# Altium schematic sheet Relay-10-Sheet.SchDoc
size 420 x 297 mm; SheetNumber: 5; SheetTotal: 5
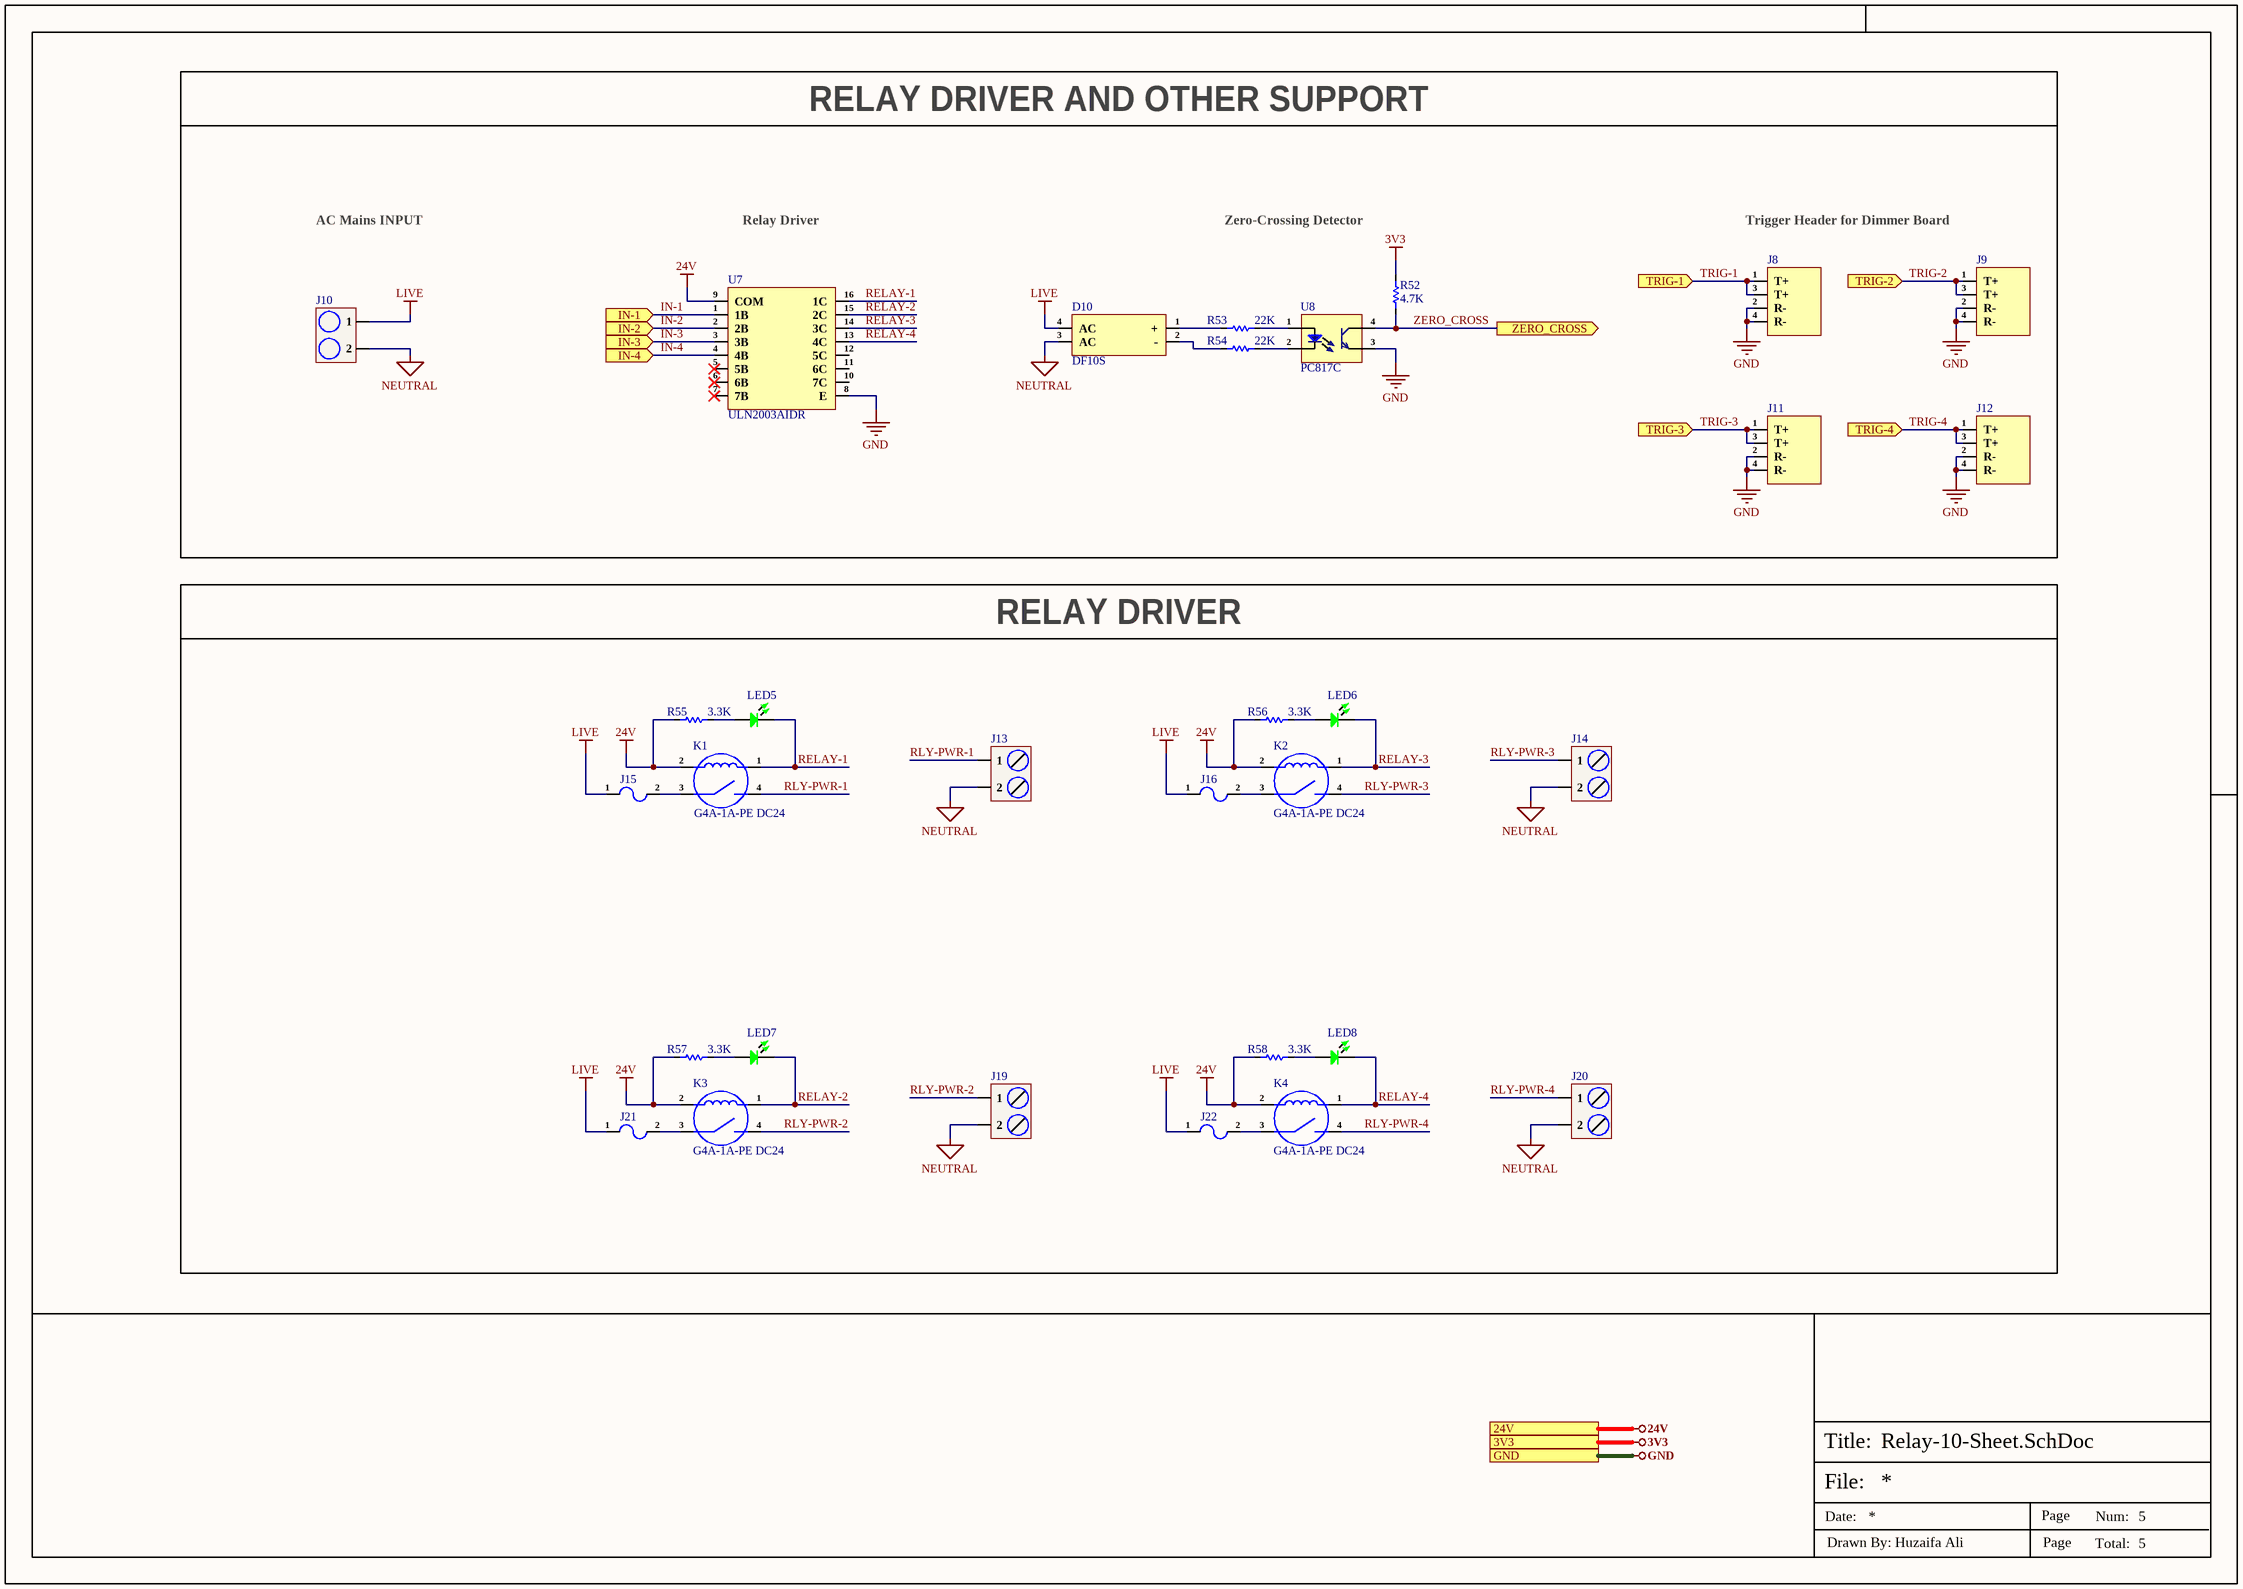
[diagram p0: Relay-10-Sheet.SchDoc]

## Parts
D10  DF10S  [DF10S]
J8  R-RJ11R04P-A802  [R-RJ11R04P-A802]  (value not drawn)
J9  R-RJ11R04P-A802  [R-RJ11R04P-A802]  (value not drawn)
J10  KF88SA-16.0-2P  [KF88SA-16.0-2P]  (value not drawn)
J11  R-RJ11R04P-A802  [R-RJ11R04P-A802]  (value not drawn)
J12  R-RJ11R04P-A802  [R-RJ11R04P-A802]  (value not drawn)
J13  DBT50G-7.62-2P-BK-P  [DBT50G-7.62-2P-BK-P]  (value not drawn)
J14  DBT50G-7.62-2P-BK-P  [DBT50G-7.62-2P-BK-P]  (value not drawn)
J15  03540101ZXGY  [03540101ZXGY]  (value not drawn)
J16  03540101ZXGY  [03540101ZXGY]  (value not drawn)
J19  DBT50G-7.62-2P-BK-P  [DBT50G-7.62-2P-BK-P]  (value not drawn)
J20  DBT50G-7.62-2P-BK-P  [DBT50G-7.62-2P-BK-P]  (value not drawn)
J21  03540101ZXGY  [03540101ZXGY]  (value not drawn)
J22  03540101ZXGY  [03540101ZXGY]  (value not drawn)
K1  G4A-1A-PE DC24  [G4A-1A-PE DC24]
K2  G4A-1A-PE DC24  [G4A-1A-PE DC24]
K3  G4A-1A-PE DC24  [G4A-1A-PE DC24]
K4  G4A-1A-PE DC24  [G4A-1A-PE DC24]
LED5  NFD5408UGD  [TH LED 5mm Green]  (value not drawn)
LED6  NFD5408UGD  [TH LED 5mm Green]  (value not drawn)
LED7  NFD5408UGD  [TH LED 5mm Green]  (value not drawn)
LED8  NFD5408UGD  [TH LED 5mm Green]  (value not drawn)
R52  4.7K  [Res-0402]
R53  22K  [RES-2512]
R54  22K  [RES-2512]
R55  3.3K  [Res-0402]
R56  3.3K  [Res-0402]
R57  3.3K  [Res-0402]
R58  3.3K  [Res-0402]
U7  ULN2003AIDR  [16-SOIC (0.154", 3.90mm Width)]
U8  PC817C  [PC817C]

## Blocks framed on the sheet
RELAY DRIVER AND OTHER SUPPORT: D10 J8-J12 R52-R54 U7 U8
RELAY DRIVER: J13-J16 J19-J22 K1-K4 LED5-LED8 R55-R58

## Ports
3V3 (see Top-Sheet[5B], Comms-Sheet[4D], Controller-Sheet[4D], Power-Sheet[4D]), 24V (see Top-Sheet[5B], Power-Sheet[4D]), GND (see Top-Sheet[5B], Comms-Sheet[4D], Controller-Sheet[4D], Power-Sheet[4D]), IN-1 (in, see Top-Sheet[5B]), IN-2 (in, see Top-Sheet[5B]), IN-3 (in, see Top-Sheet[5B]), IN-4 (in, see Top-Sheet[5B]), TRIG-1 (in, see Top-Sheet[5B]), TRIG-2 (in, see Top-Sheet[5B]), TRIG-3 (in, see Top-Sheet[5B]), TRIG-4 (in, see Top-Sheet[5B]), ZERO_CROSS (out, see Top-Sheet[5B])

## Nets
3V3: R52.2 ; port 3V3
24V: K1.2 K2.2 K3.2 K4.2 R55.1 R56.1 R57.1 R58.1 U7.9(COM) ; port 24V
GND: J8.2(R-) J8.4(R-) J9.2(R-) J9.4(R-) J11.2(R-) J11.4(R-) J12.2(R-) J12.4(R-) U7.8(E) U8.3(E) ; port GND
LIVE: D10.4(AC) J10.1 J15.1 J16.1 J21.1 J22.1
NEUTRAL: D10.3(AC) J10.2 J13.2 J14.2 J19.2 J20.2
IN-1: U7.1(1B) ; port IN-1
IN-2: U7.2(2B) ; port IN-2
IN-3: U7.3(3B) ; port IN-3
IN-4: U7.4(4B) ; port IN-4
RELAY-1: K1.1 LED5.1 U7.16(1C)
RELAY-2: K3.1 LED7.1 U7.15(2C)
RELAY-3: K2.1 LED6.1 U7.14(3C)
RELAY-4: K4.1 LED8.1 U7.13(4C)
RLY-PWR-1: J13.1 K1.4
RLY-PWR-2: J19.1 K3.4
RLY-PWR-3: J14.1 K2.4
RLY-PWR-4: J20.1 K4.4
TRIG-1: J8.1(T+) J8.3(T+) ; port TRIG-1
TRIG-2: J9.1(T+) J9.3(T+) ; port TRIG-2
TRIG-3: J11.1(T+) J11.3(T+) ; port TRIG-3
TRIG-4: J12.1(T+) J12.3(T+) ; port TRIG-4
ZERO_CROSS: R52.1 U8.4(C) ; port ZERO_CROSS
NetD10_1: D10.1(+) R53.1
NetD10_2: D10.2(-) R54.1
NetJ15_2: J15.2 K1.3
NetJ16_2: J16.2 K2.3
NetJ21_2: J21.2 K3.3
NetJ22_2: J22.2 K4.3
NetLED5_2: LED5.2 R55.2
NetLED6_2: LED6.2 R56.2
NetLED7_2: LED7.2 R57.2
NetLED8_2: LED8.2 R58.2
NetR53_2: R53.2 U8.1(An)
NetR54_2: R54.2 U8.2(Ca)

Not connected (* = marked no-connect by the designer): U7 5(5B)* 6(6B)* 7(7B)* 10(7C) 11(6C) 12(5C)

## Notes on the sheet
- AC Mains INPUT
- Relay Driver
- Zero-Crossing Detector
- Trigger Header for Dimmer Board
- File:
- Title:
- Date:
- Page
- Num:
- Total:
- Drawn By: Huzaifa Ali

## Library data of the parts
D10 = DF10S: 50A 1.1V@1A 1A 1kV DBS Bridge Rectifiers ROHS; Manufacturer: MSKSEMI; Manufacturer Part Number: DF10S; Package: DBS; LCSC Part Number: C5174636; Item Type: Bridge Rectifier; ComponentLink1Description: LCSC; ComponentLink1URL: https://www.lcsc.com/product-detail/Bridge-Rectifiers_MSKSEMI-DF10S_C5174636.html
J8 J9 J11 J12 = R-RJ11R04P-A802: RJ11Receptacle 1 Plugin Ethernet Connectors / Modular Connectors (RJ45 RJ11) ROHS; Manufacturer: Ckmtw(Shenzhen Cankemeng); Manufacturer Part Number: R-RJ11R04P-A802; Package: Plugin; LCSC Part Number: C189737; Item Type: (RJ45 RJ11); ComponentLink1Description: LCSC; ComponentLink1URL: https://www.lcsc.com/product-detail/Ethernet-Connectors-Modular-Connectors-RJ45-RJ11_Ckmtw-Shenzhen-Cankemeng-R-RJ11R04P-A802_C189737.html
J10 = KF88SA-16.0-2P: 1x2P Barrier Block 2 1 16mm -40℃~+105℃ 76A 1kV Black 6~14 Straight pin 16 Plugin,P=16mm Barrier Terminal Blocks ROHS; Manufacturer: CiXi KaiFeng Electronics; Supplier: LCSC; LCSC Part Number: C707749; Manufacturer Part Number: KF88SA-16.0-2P; RoHS: No; Item Type: Terminal Block; ComponentLink1Description: LCSC; ComponentLink1URL: https://www.lcsc.com/product-detail/Barrier-Terminal-Blocks_Cixi-Kefa-Elec-KF88SA-16-0-2P_C707749.html
J13 J14 J19 J20 = DBT50G-7.62-2P-BK-P: 1x2P Corner With Cover Plate 2 1 7.62mm -40℃~+105℃ 20A 300V Black 12~22 Straight Needle Plugin,P=7.62mm Barrier Terminal Blocks ROHS; Manufacturer: DORABO; Manufacturer Part Number: DBT50G-7.62-2P-BK-P; Package: Plugin,P=7.62mm; LCSC Part Number: C496127; Item Type: Terminal Block; ComponentLink1Description: LCSC; ComponentLink1URL: https://www.lcsc.com/product-detail/Barrier-Terminal-Blocks_DORABO-DBT50G-7-62-2P-BK-P_C496127.html
J15 J16 J21 J22 = 03540101ZXGY: FUSE BLOCK CART 600V 15A PCB; Manufacturer: Littelfuse; Body Material: Bronze,Tin; Voltage Rating: 300V; Number of Poles: 1; Fuse Size: 0.25 Dia x 1.26 L (6.35mm x 32mm); Supplier: Rs; Supplier Part Number: 1740648; Manufacturer Part Number: 03540101ZXGY; RoHS: Yes; Category: Fuse Holders; Stock: 169; Mounting Technology: Through Hole; Case/Package: 300; Contact Material: Bronze; Contact Plating: Tin; Material: Thermoplastic; Color: Grey; Min Operating Temperature: -40°C; Max Operating Temperature: 85°C; Current Rating: 15A; Package Quantity: 50; Packaging: Bulk; Voltage Rating (DC): 300V; Voltage Rating (AC): 300V; Number of Circuits: 1; Voltage: 600V; Termination: PC Pin; Fuse Current: 15A; Orientation: Horizontal; Series: OMNI-BLOK® 354; Length: 12.7mm; Width: 12.7mm; Depth: 35.56mm; Reach SVHC Compliant: No; Lead Free: Lead Free; Flammability Rating: UL94 V-0; ComponentLink1URL: https://datasheet.ciiva.com/15187/getdatasheetpartid-114928-15187899.pdf?src-supplier=Verical; ComponentLink1Description: https://datasheet.ciiva.com/15187/getdatasheetpartid-114928-15187899.pdf?src-supplier=Verical; ComponentLink2URL: https://datasheet.ciiva.com/16208/354-omniblok-16208437.pdf?src-supplier=Future+Electronics; ComponentLink2Description: https://datasheet.ciiva.com/16208/354-omniblok-16208437.pdf?src-supplier=Future+Electronics; ComponentLink3URL: https://datasheet.ciiva.com/1269/354-omniblok-1269606.pdf?src-supplier=Element14; ComponentLink3Description: https://datasheet.ciiva.com/1269/354-omniblok-1269606.pdf?src-supplier=Element14
K1-K4 = G4A-1A-PE DC24: RELAY GEN PURPOSE SPST 20A 24V; Manufacturer: Omron; Supplier: Arrow Electronics; LCSC Part Number: C231366; Manufacturer Part Number: G4A-1A-PE DC24; RoHS: Yes; Item Type: Relay; Stock: 435; Pricing: 20=4.964, 50=4.555, 100=4.412 (USD); ComponentLink1URL: https://omronfs.omron.com/en_US/ecb/products/pdf/en-g4a.pdf?src-supplier=Digikey; ComponentLink1Description: https://omronfs.omron.com/en_US/ecb/products/pdf/en-g4a.pdf?src-supplier=Digikey; ComponentLink2URL: https://datasheet.octopart.com/G4A-1A-PE-DC24-Omron-datasheet-8474777.pdf?src-supplier=Newark; ComponentLink2Description: https://datasheet.octopart.com/G4A-1A-PE-DC24-Omron-datasheet-8474777.pdf?src-supplier=Newark; ComponentLink3URL: https://datasheet.octopart.com/G4A-1A-PE-DC24-Omron-datasheet-151868987.pdf?src-supplier=Master+Electronics; ComponentLink3Description: https://datasheet.octopart.com/G4A-1A-PE-DC24-Omron-datasheet-151868987.pdf?src-supplier=Master+Electronics
LED5-LED8 = NFD5408UGD: 515nm~525nm -30℃~+85℃ Emerald 30° 200mW Plugin,D=5mm LED Indication - Discrete ROHS; Manufacturer: Foshan; Manufacturer Part Number: NFD5408UGD; Package: Plugin,D=5mm; LCSC Part Number: C20618157; Item Type: LED; ComponentLink1Description: LCSC; ComponentLink1URL: https://www.lcsc.com/product-detail/LED-Indication-Discrete_Foshan-NationStar-Optoelectronics-NFD5408UGD_C20618157.html
R52 = RC0402FR-074K7L: RES 4.7K OHM 1% 1/16W 0402; Manufacturer: Yageo; Voltage Rating (DC): 50V; Power Rating: 62.5mW; Resistance: 4.7kR; Temperature Coefficient: 100ppm/°C; Max Power Dissipation: 63mW; Item Type: Resistor; Supplier 1: Avnet; Manufacturer Part Number: RC0402FR-074K7L; RoHS: Yes; Category: Chip SMD Resistors; Stock 1: 2420000; Pricing 1: 10000=0.00085 (USD); Case/Package: 0402; Number of Pins: 2; Case Code (Imperial): 0402; Case Code (Metric): 1005; Size Code: 0402; Min Operating Temperature: -55°C; Max Operating Temperature: 155°C; Tolerance: 1%; Voltage Rating: 50V; Packaging: Tape and Reel; Resistor Type: Thick Film; Termination: SMD/SMT; Features: Moisture Resistant; Series: RC; Number of Terminations: 2; Resistance Tolerance: 1%; Construction: Rectangular; Length: 1mm; Width: 0.5mm; Height: 0.32mm; Depth: 0.5mm; Height - Seated (Max): 0.016inch; RoHS Compliant: Yes; Reach SVHC Compliant: Yes; Military Standard: Not; Lead Free: Lead Free; ComponentLink1URL: https://datasheet.ciiva.com/22661/1686128-22661342.pdf?src-supplier=Element14; ComponentLink1Description: https://datasheet.ciiva.com/22661/1686128-22661342.pdf?src-supplier=Element14; ComponentLink2URL: https://datasheet.ciiva.com/7850/1018594-7850022.pdf?src-supplier=Element14; ComponentLink2Description: https://datasheet.ciiva.com/7850/1018594-7850022.pdf?src-supplier=Element14; ComponentLink3URL: https://datasheet.ciiva.com/7850/1018594-7850023.pdf?src-supplier=Element14; ComponentLink3Description: https://datasheet.ciiva.com/7850/1018594-7850023.pdf?src-supplier=Element14; ComponentLink4URL: https://datasheet.ciiva.com/15215/getdatasheetpartid-328119-15215035.pdf?src-supplier=Verical; ComponentLink4Description: https://datasheet.ciiva.com/15215/getdatasheetpartid-328119-15215035.pdf?src-supplier=Verical; Supplier Part Number 1: RC0402FR-074K7L; LCSC Part Number: C105871
R53 R54 = WR25X223JTL: 1W 250V ±100ppm/℃ ±5% 22kΩ 2512 Chip Resistor - Surface Mount ROHS; Manufacturer: Walsin Tech Corp; Manufacturer Part Number: WR25X223JTL; Package: 2512; LCSC Part Number: C396242; Item Type: Resistor; ComponentLink1Description: LCSC; ComponentLink1URL: https://www.lcsc.com/product-detail/Chip-Resistor-Surface-Mount_Walsin-Tech-Corp-WR25X223JTL_C396242.html
R55-R58 = RC0402FR-073K3L: RES 3.3K OHM 1% 1/16W 0402; Manufacturer: Yageo; Resistance: 3.3kR; Power Rating: 62.5mW; Voltage Rating: 50V; Temperature Coefficient: 100ppm/°C; Max Power Dissipation: 63mW; Item Type: Resistor; Supplier 1: Mouser; Manufacturer Part Number: RC0402FR-073K3L; RoHS: Yes; Category: Chip SMD Resistors; Stock 1: 2413047; Pricing 1: 1=0.10000, 10=0.01400, 50=0.01400, 100=0.00600, 1000=0.00300, 5000=0.00200, 10000=0.00100 (USD); Case/Package: 0402; Number of Pins: 2; Case Code (Imperial): 0402; Case Code (Metric): 1005; Size Code: 0402; Min Operating Temperature: -55°C; Max Operating Temperature: 155°C; Tolerance: 1%; Voltage Rating (DC): 50V; Packaging: Tape and Reel; Package Quantity: 1; Termination: SMD/SMT; Resistor Type: Thick Film; Number of Terminations: 2; Features: Moisture Resistant; Series: RC; Resistance Tolerance: 1%; Technology: THICK FILM; Construction: Rectangular; Length: 1mm; Width: 0.5mm; Height: 0.016inch; Depth: 0.5mm; RoHS Compliant: Yes; REACH SVHC: No SVHC; Military Standard: Not; Lead Free: Lead Free; ComponentLink1URL: https://datasheet.ciiva.com/11808/0900766b80c66297-11808441.pdf?src-supplier=RSComponents; ComponentLink1Description: https://datasheet.ciiva.com/11808/0900766b80c66297-11808441.pdf?src-supplier=RSComponents; ComponentLink2URL: https://datasheet.ciiva.com/46394/1018594-46394940.pdf?src-supplier=Element14; ComponentLink2Description: https://datasheet.ciiva.com/46394/1018594-46394940.pdf?src-supplier=Element14; ComponentLink3URL: https://datasheet.ciiva.com/2453/pyu-r-int-thick-7-2453395.pdf?src-supplier=Digi-Key; ComponentLink3Description: https://datasheet.ciiva.com/2453/pyu-r-int-thick-7-2453395.pdf?src-supplier=Digi-Key; ComponentLink4URL: https://datasheet.ciiva.com/2453/pyu-r-int-thick-7-2453396.pdf?src-supplier=Digi-Key; ComponentLink4Description: https://datasheet.ciiva.com/2453/pyu-r-int-thick-7-2453396.pdf?src-supplier=Digi-Key; ComponentLink5URL: https://datasheet.ciiva.com/2453/pyu-r-int-thick-7-2453394.pdf?src-supplier=Digi-Key; ComponentLink5Description: https://datasheet.ciiva.com/2453/pyu-r-int-thick-7-2453394.pdf?src-supplier=Digi-Key; ComponentLink6URL: https://datasheet.ciiva.com/16746/pyu-rc0402-51-rohs-l-6-r-16746361.pdf?src-supplier=Future+Electronics; ComponentLink6Description: https://datasheet.ciiva.com/16746/pyu-rc0402-51-rohs-l-6-r-16746361.pdf?src-supplier=Future+Electronics; Supplier Part Number 1: 603-RC0402FR-073K3L; LCSC Part Number: C137992
U7 = ULN2003AIDR: IC PWR RELAY 7NPN 1:1 16SOIC; Manufacturer: Texas Instruments; Supplier: Mouser; Supplier Part Number: 595-ULN2003AIDR; Manufacturer Part Number: ULN2003AIDR; RoHS: Yes; Item Type: IC; Stock: 2012; Pricing: 1=0.66, 10=0.589, 50=0.589, 100=0.402, 1000=0.285, 10000=0.232 (USD); ComponentLink1URL: https://datasheet.ciiva.com/15139/getdatasheetpartid-47948-15139878.pdf?src-supplier=Verical; ComponentLink1Description: https://datasheet.ciiva.com/15139/getdatasheetpartid-47948-15139878.pdf?src-supplier=Verical; ComponentLink2URL: https://datasheet.ciiva.com/14424/ulq2003a-14424030.pdf?src-supplier=Avnet; ComponentLink2Description: https://datasheet.ciiva.com/14424/ulq2003a-14424030.pdf?src-supplier=Avnet; ComponentLink3URL: https://datasheet.ciiva.com/1700/uln2003ai-1700820.pdf?src-supplier=Digikey; ComponentLink3Description: https://datasheet.ciiva.com/1700/uln2003ai-1700820.pdf?src-supplier=Digikey; ComponentLink4URL: https://datasheet.ciiva.com/1700/uln2003ai-1700821.pdf?src-supplier=Digikey; ComponentLink4Description: https://datasheet.ciiva.com/1700/uln2003ai-1700821.pdf?src-supplier=Digikey; ComponentLink5URL: https://datasheet.ciiva.com/1700/uln2003ai-1700822.pdf?src-supplier=Digikey; ComponentLink5Description: https://datasheet.ciiva.com/1700/uln2003ai-1700822.pdf?src-supplier=Digikey
U8 = PC817C: 70V 5kV 50mA 100mV@1mA,20mA 1 6V 1.2V DC SMD-4 Transistor Output Optocoupler ROHS; Manufacturer: Slkor; Item Type: IC; Manufacturer Part Number: PC817C; Package: SMD-4; LCSC Part Number: C2936043; ComponentLink1Description: LCSC; ComponentLink1URL: https://www.lcsc.com/product-detail/Transistor-Output-Optocoupler_Slkor-SLKORMICRO-Elec-PC817C_C2936043.html